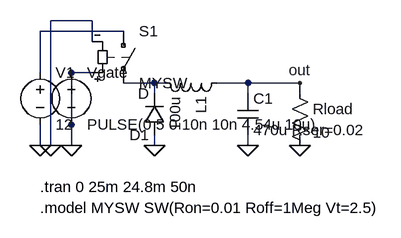
[diagram p0: schematic buck_12v_5v.asc]
buck_12v_5v.asc, the LTspice schematic file:
Version 4
SHEET 1 880 680
SYMBOL voltage 32 112 R0
SYMATTR InstName V1
SYMATTR Value 12
SYMBOL voltage 80 112 R0
SYMATTR InstName Vgate
SYMATTR Value PULSE(0 5 0 10n 10n 4.54u 10u)
SYMBOL sw 160 48 R0
SYMATTR InstName S1
SYMATTR Value MYSW
SYMBOL diode 224 224 R180
SYMATTR InstName D1
SYMATTR Value D
SYMBOL ind 320 128 R90
SYMATTR InstName L1
SYMATTR Value 100u
SYMBOL cap 336 160 R0
SYMATTR InstName C1
SYMATTR Value 470u Rser=0.02
SYMBOL res 416 144 R0
SYMATTR InstName Rload
SYMATTR Value 10
WIRE 160 64 32 64
WIRE 32 128 32 64
WIRE 32 240 32 208
WIRE 112 128 80 128
WIRE 80 208 80 128
WIRE 80 240 80 208
WIRE 112 80 112 48
WIRE 112 48 48 48
WIRE 48 48 48 240
WIRE 208 144 160 144
WIRE 208 160 208 144
WIRE 208 240 208 224
WIRE 224 144 208 144
WIRE 352 144 304 144
WIRE 352 160 352 144
WIRE 352 240 352 224
WIRE 432 144 352 144
WIRE 432 160 432 144
WIRE 432 240 432 224
FLAG 32 240 0
FLAG 48 240 0
FLAG 80 240 0
FLAG 208 240 0
FLAG 352 240 0
FLAG 432 240 0
FLAG 432 144 out
TEXT 32 304 Left 2 !.tran 0 25m 24.8m 50n
TEXT 32 336 Left 2 !.model MYSW SW(Ron=0.01 Roff=1Meg Vt=2.5)

The netlist it stands for:
* buck_12v_5v.asc
V1 N001 0 12
Vgate 0 0 PULSE(0 5 0 10n 10n 4.54u 10u)
S1 N001 N002 0 0 MYSW
D1 0 N002 D
L1 out N002 100u
C1 out 0 470u Rser=0.02
Rload out 0 10
.model D D
.lib standard.dio
.tran 0 25m 24.8m 50n
.model MYSW SW(Ron=0.01 Roff=1Meg Vt=2.5)
.backanno
.end